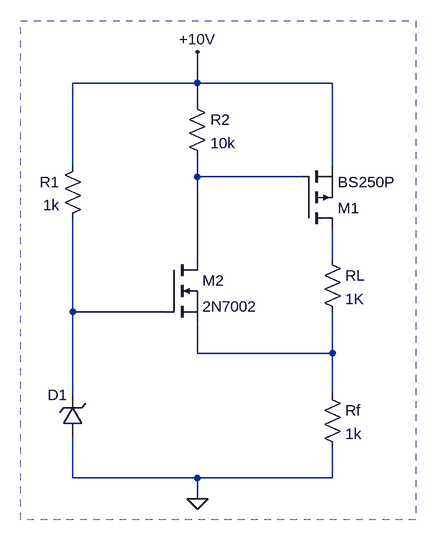
[diagram p0: schematic Guia 2 - Ej 2.9b.asc]
Guia 2 - Ej 2.9b.asc, the LTspice schematic file:
Version 4
SHEET 1 7772 18116
WIRE 4432 2928 4432 2880
WIRE 4432 2928 4240 2928
WIRE 4640 2928 4432 2928
WIRE 4432 2960 4432 2928
WIRE 4240 3056 4240 2928
WIRE 4640 3056 4640 2928
WIRE 4432 3072 4432 3040
WIRE 4592 3072 4432 3072
WIRE 4432 3200 4432 3072
WIRE 4640 3200 4640 3152
WIRE 4240 3280 4240 3136
WIRE 4384 3280 4240 3280
WIRE 4432 3344 4432 3296
WIRE 4640 3344 4640 3280
WIRE 4640 3344 4432 3344
WIRE 4240 3408 4240 3280
WIRE 4640 3408 4640 3344
WIRE 4240 3536 4240 3472
WIRE 4432 3536 4240 3536
WIRE 4640 3536 4640 3488
WIRE 4640 3536 4432 3536
WIRE 4432 3568 4432 3536
FLAG 4432 2880 +10V
FLAG 4432 3568 0
SYMBOL nmos 4384 3200 R0
SYMATTR InstName M2
SYMATTR Value 2N7002
SYMBOL zener 4256 3472 R180
WINDOW 0 24 64 Left 2
WINDOW 3 24 0 Invisible 2
SYMATTR InstName D1
SYMBOL res 4256 3040 M0
SYMATTR InstName R1
SYMATTR Value 1k
SYMBOL res 4416 2944 R0
SYMATTR InstName R2
SYMATTR Value 10k
SYMBOL pmos 4592 3152 M180
SYMATTR InstName M1
SYMATTR Value BS250P
SYMBOL res 4624 3392 R0
SYMATTR InstName Rf
SYMATTR Value 1k
SYMBOL res 4624 3184 R0
SYMATTR InstName RL
SYMATTR Value 1K
RECTANGLE Normal 4768 3600 4160 2832 2

The netlist it stands for:
* Guia 2 - Ej 2.9b.asc
M2 N001 N003 N004 N004 2N7002
D1 0 N003 D
R1 +10V N003 1k
R2 +10V N001 10k
M1 N002 N001 +10V +10V BS250P
Rf N004 0 1k
RL N002 N004 1K
.model D D
.lib standard.dio
.model NMOS NMOS
.model PMOS PMOS
.lib standard.mos
.backanno
.end